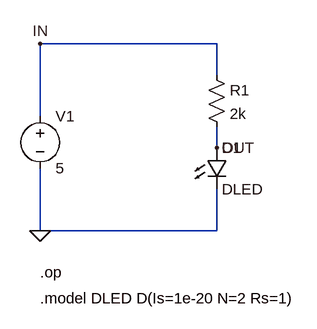
[diagram p0: schematic 01-led-2k.asc]
01-led-2k.asc, the LTspice schematic file:
Version 4
SHEET 1 880 680
WIRE 128 64 400 64
WIRE 128 64 128 176
WIRE 400 64 400 112
WIRE 400 192 400 224
WIRE 400 288 400 352
WIRE 400 352 128 352
WIRE 128 352 128 256
FLAG 128 352 0
FLAG 128 64 IN
FLAG 400 224 OUT
SYMBOL voltage 128 160 R0
SYMATTR InstName V1
SYMATTR Value 5
SYMBOL res 384 96 R0
SYMATTR InstName R1
SYMATTR Value 2k
SYMBOL LED 384 224 R0
SYMATTR InstName D1
SYMATTR Value DLED
TEXT 128 416 Left 2 !.op
TEXT 128 456 Left 2 !.model DLED D(Is=1e-20 N=2 Rs=1)

The netlist it stands for:
* 01-led-2k.asc
V1 IN 0 5
R1 IN OUT 2k
D1 OUT 0 DLED
.model D D
.lib standard.dio
.op
.model DLED D(Is=1e-20 N=2 Rs=1)
.backanno
.end

* Results of the author's LTspice run, read from the files saved beside the schematic
* Operating Point:
*   V(in) = 5 V
*   V(out) = 2.047 V
*   I(D1) = 1.477 mA
*   I(R1) = 1.477 mA
*   I(V1) = -1.477 mA